# Altium schematic sheet I2C_INTERFACE.SchDoc
size A4; SheetNumber: 12; SheetTotal: 20
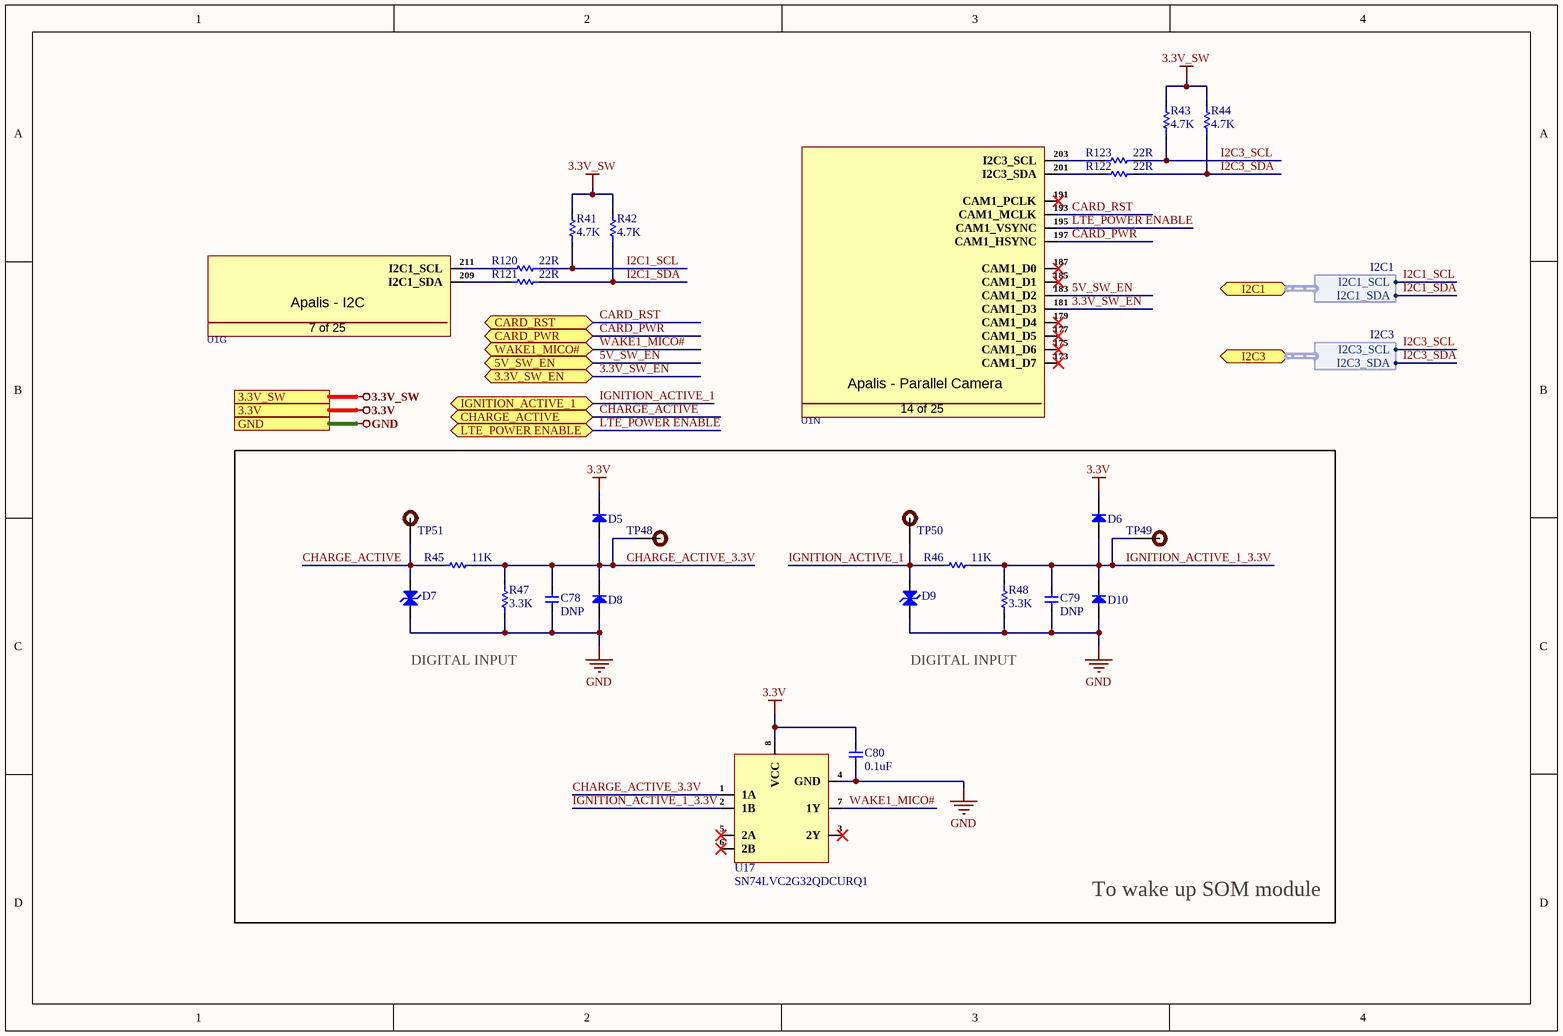
[diagram p0: I2C_INTERFACE.SchDoc]

## Parts
C78  DNP  [Cap-0603]
C79  DNP  [Cap-0603]
C80  0.1uF  [Cap-0402]
D5  BAS316,115  [SOD-323]  (value not drawn)
D6  BAS316,115  [SOD-323]  (value not drawn)
D7  SMAJ14CA-E3/61  [SMA]  (value not drawn)
D8  BAS316,115  [SOD-323]  (value not drawn)
D9  SMAJ14CA-E3/61  [SMA]  (value not drawn)
D10  BAS316,115  [SOD-323]  (value not drawn)
R41  4.7K  [Res-0603]
R42  4.7K  [Res-0603]
R43  4.7K  [Res-0603]
R44  4.7K  [Res-0603]
R45  11K  [Res-0603]
R46  11K  [Res-0603]
R47  3.3K  [Res-0603]
R48  3.3K  [Res-0603]
R120  22R  [Res-0402]
R121  22R  [Res-0402]
R122  22R  [Res-0402]
R123  22R  [Res-0402]
TP48  DNP  [Test-point]  (value not drawn)
TP49  DNP  [Test-point]  (value not drawn)
TP50  DNP  [Test-point]  (value not drawn)
TP51  DNP  [Test-point]  (value not drawn)
U1  MM70-314B1-2-R300  [MM70-314B1-2-R300]  (value not drawn)  (parts G,N of 25)
U17  SN74LVC2G32QDCURQ1  [8-VSSOP]

## Blocks framed on the sheet
To wake up SOM module: C78-C80 D5-D10 R45-R48 TP48-TP51 U17

## Ports
3.3V (see Top_Sheet[3C], 03-CAN2_SPI_CAN_CONTROLLER[1D], APALIS_POWER_SUPPLY[1D], CAN2_SPI_CAN_CONTROLLER[1D], DC_DC_CONVERTER[1D], GPIO_NC_INTERFACE[4B], LTE_MODULE[1D], Reset_and_SDIO[1D]), 3.3V_SW (see Top_Sheet[3C], DIGITAL_I-O_O-P[1D], ETHERNET_INTERFACE[1D], FUTURE_USE_CONNECTOR[1D], HDMI_INTERFACE[1D], MICRO_SD_CARD_INTERFACE[1D], UART_INTERFACE[1D]), 3.3V_SW_EN (bidir, see Top_Sheet[3D], CONNECTORS[2D]), 5V_SW_EN (bidir, see Top_Sheet[3D], CONNECTORS[2D]), CARD_PWR (bidir, see Top_Sheet[2C], LTE_MODULE[3D]), CARD_RST (bidir, see Top_Sheet[2D], LTE_MODULE[3D]), CHARGE_ACTIVE (bidir, see Top_Sheet[3D], CONNECTORS[4D]), GND (see Top_Sheet[2C], 03-CAN2_SPI_CAN_CONTROLLER[1D], APALIS_POWER_SUPPLY[1D], CAN2_SPI_CAN_CONTROLLER[1D], CODEC_INTERFACE[1D], CONNECTORS[1D], DC_DC_CONVERTER[1D], DIGITAL_I-O_O-P[1D], ETHERNET_INTERFACE[1D], FUTURE_USE_CONNECTOR[1D], GPIO_NC_INTERFACE[4B], HDMI_INTERFACE[1D], INPUT_SUPPLY_PROTECTION[1D], LTE_MODULE[1D], MECHANICAL_FOR_PCB[1D], MICRO_SD_CARD_INTERFACE[1D], Reset_and_SDIO[1D], UART_INTERFACE[1D], USB3.0_INTERFACE[1D]), I2C1 (bidir, harness I2C1, see Top_Sheet[3D], CONNECTORS[2C], FUTURE_USE_CONNECTOR[2D]), I2C3 (bidir, harness I2C3, see Top_Sheet[3C], CODEC_INTERFACE[3D], CONNECTORS[2C]), IGNITION_ACTIVE_1 (bidir, see Top_Sheet[3D], CONNECTORS[4D]), LTE_POWER ENABLE (bidir, see Top_Sheet[2D], LTE_MODULE[3D]), WAKE1_MICO# (bidir, see Top_Sheet[2C], FUTURE_USE_CONNECTOR[4C], Reset_and_SDIO[3D])

## Harnesses
I2C3: I2C3_SCL, I2C3_SDA
I2C1: I2C1_SCL, I2C1_SDA

## Nets
3.3V: C80.2 D5.1(K) D6.1(K) U17.8(VCC) ; port 3.3V
3.3V_SW: R41.2 R42.2 R43.2 R44.2 ; port 3.3V_SW
GND: C78.1 C79.1 C80.1 D7.1(A) D8.2(A) D9.1(A) D10.2(A) R47.1 R48.1 U17.4(GND) ; port GND
3.3V_SW_EN: U1.181(CAM1_D3) ; port 3.3V_SW_EN
5V_SW_EN: U1.183(CAM1_D2) ; port 5V_SW_EN
CARD_PWR: U1.197(CAM1_HSYNC) ; port CARD_PWR
CARD_RST: U1.193(CAM1_MCLK) ; port CARD_RST
CHARGE_ACTIVE: D7.2(A) R45.1 TP51.1 ; port CHARGE_ACTIVE
CHARGE_ACTIVE_3.3V: C78.2 D5.2(A) D8.1(K) R45.2 R47.2 TP48.1 U17.1(1A)
I2C1_SCL: R41.1 R120.2 ; port I2C1.I2C1_SCL
I2C1_SDA: R42.1 R121.2 ; port I2C1.I2C1_SDA
I2C3_SCL: R43.1 R123.2 ; port I2C3.I2C3_SCL
I2C3_SDA: R44.1 R122.2 ; port I2C3.I2C3_SDA
IGNITION_ACTIVE_1: D9.2(A) R46.1 TP50.1 ; port IGNITION_ACTIVE_1
IGNITION_ACTIVE_1_3.3V: C79.2 D6.2(A) D10.1(K) R46.2 R48.2 TP49.1 U17.2(1B)
LTE_POWER ENABLE: U1.195(CAM1_VSYNC) ; port LTE_POWER ENABLE
WAKE1_MICO#: U17.7(1Y) ; port WAKE1_MICO#
NetR120_1: R120.1 U1.211(I2C1_SCL)
NetR121_1: R121.1 U1.209(I2C1_SDA)
NetR122_1: R122.1 U1.201(I2C3_SDA)
NetR123_1: R123.1 U1.203(I2C3_SCL)

Not connected (* = marked no-connect by the designer): U1 173(CAM1_D7)* 175(CAM1_D6)* 177(CAM1_D5)* 179(CAM1_D4)* 185(CAM1_D1)* 187(CAM1_D0)* 191(CAM1_PCLK)*; U17 3(2Y)* 5(2A)* 6(2B)*

## Notes on the sheet
- DIGITAL INPUT
- (in symbol MM70-314B1-2-R300, part G) Apalis - I2C; 7 of 25
- (in symbol MM70-314B1-2-R300, part N) Apalis - Parallel Camera; 14 of 25

## Library data of the parts
C78 C79 = C1608NP01H101J080AA: CAP CER 100PF 50V NP0 0603; Manufacturer: TDK; Item Type: Capacitor; Supplier: Arrow Electronics; Supplier Part Number: C1608NP01H101J080AA; Manufacturer Part Number: C1608NP01H101J080AA; RoHS: Yes; Category: Ceramic Capacitors; Stock: 1236; Pricing: 1=0.1172, 10=0.0734, 25=0.0727, 50=0.0628, 100=0.0474, 250=0.0469, 500=0.0388, 1000=0.0313 (USD); ComponentLink1URL: http://www.mouser.com/ds/2/400/tdk_mlcc_commercial_general_en-542463.pdf?src-supplier=Mouser; ComponentLink1Description: http://www.mouser.com/ds/2/400/tdk_mlcc_commercial_general_en-542463.pdf?src-supplier=Mouser; ComponentLink2URL: https://datasheet.octopart.com/C1608NP01H101J080AA-TDK-datasheet-43914282.pdf?src-supplier=Future+Electronics; ComponentLink2Description: https://datasheet.octopart.com/C1608NP01H101J080AA-TDK-datasheet-43914282.pdf?src-supplier=Future+Electronics; ComponentLink3URL: https://product.tdk.com/info/en/catalog/datasheets/mlcc_commercial_hightemp_en.pdf?ref_disty=digikey&src-supplier=Digi-Key; ComponentLink3Description: https://product.tdk.com/info/en/catalog/datasheets/mlcc_commercial_hightemp_en.pdf?ref_disty=digikey&src-supplier=Digi-Key; ComponentLink4URL: https://product.tdk.com/info/en/documents/chara_sheet/C1608NP01H101J080AA.pdf?src-supplier=Digi-Key; ComponentLink4Description: https://product.tdk.com/info/en/documents/chara_sheet/C1608NP01H101J080AA.pdf?src-supplier=Digi-Key; ComponentLink5URL: http://product.tdk.com/en/catalog/datasheets/mlcc_commercial_hightemp_en.pdf?src-supplier=Avnet; ComponentLink5Description: http://product.tdk.com/en/catalog/datasheets/mlcc_commercial_hightemp_en.pdf?src-supplier=Avnet
C80 = C0402C104K4REC7867: Cap Cer 0402 0.1UF 16V X7R 10%; Manufacturer: KEMET; Item Type: Capacitor; Supplier: Digi-Key; Supplier Part Number: 399-C0402C104K4REC7867CT-ND; Manufacturer Part Number: C0402C104K4REC7867; RoHS: No; Category: Ceramic Capacitors; Stock: 10918; Pricing: 1=0.1, 10=0.072, 50=0.0408, 100=0.0338, 500=0.02372, 1000=0.01963, 2500=0.01827, 5000=0.01672 (USD)
D5 D6 D8 D10 = BAS316,115: Rectifier Diode Switching 100V 0.25A 4ns Automotive 2-Pin SOD-323 T/R; Manufacturer: Nexperia; Forward Current: 250mA; Max Forward Surge Current (Ifsm): 500mA; Value: 1.5pF; Max Reverse Current: 500nA; Supplier: Rs; Supplier Part Number: 1821844P; Manufacturer Part Number: BAS316,115; RoHS: Yes; Category: Rectifier Diodes; Stock: 258600; Pricing: 600=0.062, 1200=0.039, 1800=0.037, 2400=0.035 (GBP); Pins: 2NUMBER; Max Operating Temperature: 150°C; Max Repetitive Reverse Voltage (Vrrm): 100V; Packaging: 10Packaging; Reverse Voltage: 100V; Height: 1.1mm; RoHS Compliant: Yes; ComponentLink1URL: http://www.farnell.com/datasheets/1856332.pdf?src-supplier=Farnell; ComponentLink1Description: http://www.farnell.com/datasheets/1856332.pdf?src-supplier=Farnell; ComponentLink2URL: https://assets.nexperia.com/documents/data-sheet/BAS16_SER.pdf?src-supplier=Digi-Key; ComponentLink2Description: https://assets.nexperia.com/documents/data-sheet/BAS16_SER.pdf?src-supplier=Digi-Key; ComponentLink3URL: https://datasheet.octopart.com/BAS316%2C115-Nexperia-datasheet-77871323.pdf?src-supplier=Future+Electronics; ComponentLink3Description: https://datasheet.octopart.com/BAS316%2C115-Nexperia-datasheet-77871323.pdf?src-supplier=Future+Electronics; ComponentLink4URL: https://datasheet.octopart.com/BAS316%2C115-Nexperia-datasheet-32749520.pdf?src-supplier=Element14; ComponentLink4Description: https://datasheet.octopart.com/BAS316%2C115-Nexperia-datasheet-32749520.pdf?src-supplier=Element14; ComponentLink5URL: http://www.farnell.com/datasheets/1856332.pdf?src-supplier=Newark; ComponentLink5Description: http://www.farnell.com/datasheets/1856332.pdf?src-supplier=Newark; ComponentLink6URL: https://datasheet.octopart.com/BAS316%2C115-NXP-datasheet-5319124.pdf?src-supplier=TME; ComponentLink6Description: https://datasheet.octopart.com/BAS316%2C115-NXP-datasheet-5319124.pdf?src-supplier=TME
D7 D9 = SMAJ14CA-E3/61: TVS DIODE 14VWM 23.2VC DO214AC; Manufacturer: Vishay Semiconductors; Supplier: Mouser; Supplier Part Number: 625-SMAJ14CA-E3; Manufacturer Part Number: SMAJ14CA-E3/61; RoHS: Yes; Category: TVS Diodes; Stock: 15510; Pricing: 1=0.48, 10=0.36, 50=0.36, 100=0.221, 1000=0.127, 10000=0.099 (USD); ComponentLink1URL: https://datasheet.ciiva.com/4515/smaj50a-241759-4515304.pdf?src-supplier=Mouser; ComponentLink1Description: https://datasheet.ciiva.com/4515/smaj50a-241759-4515304.pdf?src-supplier=Mouser; ComponentLink2URL: https://datasheet.ciiva.com/16382/smaj50a-16382075.pdf?src-supplier=Future+Electronics; ComponentLink2Description: https://datasheet.ciiva.com/16382/smaj50a-16382075.pdf?src-supplier=Future+Electronics
R41-R44 = ERA-3AEB472V: RES SMD 4.7K OHM 0.1% 1/10W 0603; Manufacturer: Panasonic; Supplier: Rs; Supplier Part Number: 566888P; Manufacturer Part Number: ERA-3AEB472V; RoHS: Yes; Category: Chip SMD Resistors; Stock: 5210; Pricing: 50=0.242, 100=0.198, 250=0.156, 500=0.114 (GBP); ComponentLink1URL: https://datasheet.ciiva.com/11808/0900766b80fe20f7-11808039.pdf?src-supplier=Rs; ComponentLink1Description: https://datasheet.ciiva.com/11808/0900766b80fe20f7-11808039.pdf?src-supplier=Rs; ComponentLink2URL: https://datasheet.ciiva.com/29183/451124-da-01-en-widerstand-0603-era-29183789.pdf?src-supplier=Conrad; ComponentLink2Description: https://datasheet.ciiva.com/29183/451124-da-01-en-widerstand-0603-era-29183789.pdf?src-supplier=Conrad; ComponentLink3URL: https://datasheet.ciiva.com/22743/485442-22743061.pdf?src-supplier=Element14; ComponentLink3Description: https://datasheet.ciiva.com/22743/485442-22743061.pdf?src-supplier=Element14; ComponentLink4URL: https://datasheet.ciiva.com/46422/485442-46422693.pdf?src-supplier=Element14; ComponentLink4Description: https://datasheet.ciiva.com/46422/485442-46422693.pdf?src-supplier=Element14; ComponentLink5URL: https://datasheet.ciiva.com/30078/54aoa0000ce26-30078815.pdf?src-supplier=Onlinecomponents.com; ComponentLink5Description: https://datasheet.ciiva.com/30078/54aoa0000ce26-30078815.pdf?src-supplier=Onlinecomponents.com; ComponentLink6URL: https://datasheet.ciiva.com/16772/70068849-16772572.pdf?src-supplier=Allied+Electronics; ComponentLink6Description: https://datasheet.ciiva.com/16772/70068849-16772572.pdf?src-supplier=Allied+Electronics; ComponentLink7URL: https://datasheet.ciiva.com/48425/era-eng-tds-48425470.pdf?src-supplier=Distrelec; ComponentLink7Description: https://datasheet.ciiva.com/48425/era-eng-tds-48425470.pdf?src-supplier=Distrelec; ComponentLink8URL: https://datasheet.ciiva.com/22781/485442-22781497.pdf?src-supplier=Farnell; ComponentLink8Description: https://datasheet.ciiva.com/22781/485442-22781497.pdf?src-supplier=Farnell; ComponentLink9URL: https://datasheet.ciiva.com/43455/485442-43455227.pdf?src-supplier=Farnell; ComponentLink9Description: https://datasheet.ciiva.com/43455/485442-43455227.pdf?src-supplier=Farnell; ComponentLink10URL: https://datasheet.ciiva.com/9117/aoa0000ce26-9117707.pdf?src-supplier=Avnet; ComponentLink10Description: https://datasheet.ciiva.com/9117/aoa0000ce26-9117707.pdf?src-supplier=Avnet; ComponentLink11URL: https://datasheet.ciiva.com/9116/aoa0000ce26-9116681.pdf?src-supplier=Avnet; ComponentLink11Description: https://datasheet.ciiva.com/9116/aoa0000ce26-9116681.pdf?src-supplier=Avnet
R45 R46 = RT0603DRD0711KL: RES SMD 11K OHM 0.5% 1/10W 0603; Manufacturer: Yageo; Supplier: Future Electronics; Supplier Part Number: 3061514; Manufacturer Part Number: RT0603DRD0711KL; RoHS: Yes; Category: Chip SMD Resistors; Stock: 70000; Pricing: 5000=0.0133, 15000=0.0128, 25000=0.0126, 100000=0.012, 150000=0.0117 (USD); ComponentLink1URL: https://datasheet.ciiva.com/8891/pyu-rt-1-to-0-05-rohs-l-4-8891301.pdf?src-supplier=Avnet; ComponentLink1Description: https://datasheet.ciiva.com/8891/pyu-rt-1-to-0-05-rohs-l-4-8891301.pdf?src-supplier=Avnet
R47 R48 = ERJ-U3RD3301V: RES 3.3K OHM 0.5% 1/10W 0603 SMD; Manufacturer: Panasonic; Supplier: Mouser; Supplier Part Number: 667-ERJ-U3RD3301V; Manufacturer Part Number: ERJ-U3RD3301V; RoHS: No; Category: Chip SMD Resistors; Stock: 19153; Pricing: 1=0.19, 10=0.105, 50=0.105, 100=0.047, 1000=0.029, 10000=0.023 (USD)
R120-R123 = CRGCQ0402J22R: RES 22 OHM 5% 1/16W 0402; Manufacturer: TE Connectivity; Supplier: Avnet; Supplier Part Number: 73AC8982; Manufacturer Part Number: CRGCQ0402J22R; RoHS: Yes; Category: Chip SMD Resistors; Stock: 20000; Pricing: 1=0.036, 25=0.01, 100=0.008, 250=0.006, 500=0.005 (USD); ComponentLink1URL: https://www.te.com/commerce/DocumentDelivery/DDEController?Action=srchrtrv&amp;DocNm=1773204-3&amp;DocType=DS&amp;DocLang=English&src-supplier=Digi-Key; ComponentLink1Description: https://www.te.com/commerce/DocumentDelivery/DDEController?Action=srchrtrv&amp;DocNm=1773204-3&amp;DocType=DS&amp;DocLang=English&src-supplier=Digi-Key; ComponentLink2URL: https://4donline.ihs.com/images/VipMasterIC/IC/TYEL/TYEL-S-A0004929575/TYEL-S-A0004929575-1.pdf?hkey=52A5661711E402568146F3353EA87419&src-supplier=Newark; ComponentLink2Description: https://4donline.ihs.com/images/VipMasterIC/IC/TYEL/TYEL-S-A0004929575/TYEL-S-A0004929575-1.pdf?hkey=52A5661711E402568146F3353EA87419&src-supplier=Newark; ComponentLink3URL: https://4donline.ihs.com/images/VipMasterIC/IC/TYEL/TYEL-S-A0004929575/TYEL-S-A0004929575-1.pdf?hkey=52A5661711E402568146F3353EA87419&src-supplier=Element14; ComponentLink3Description: https://4donline.ihs.com/images/VipMasterIC/IC/TYEL/TYEL-S-A0004929575/TYEL-S-A0004929575-1.pdf?hkey=52A5661711E402568146F3353EA87419&src-supplier=Element14; ComponentLink4URL: https://datasheet.octopart.com/CRGCQ0402J22R-TE-Connectivity-datasheet-114679081.pdf?src-supplier=Master+Electronics; ComponentLink4Description: https://datasheet.octopart.com/CRGCQ0402J22R-TE-Connectivity-datasheet-114679081.pdf?src-supplier=Master+Electronics
TP48-TP51 = TEST POINT: Test Point ON; Item Type: TEST POINT
U1 = MM70-314B1-2-R300: CONN MXM 3.0 FMALE 314POS 0.020; Manufacturer: JAE Electronics; Supplier: Digi-Key; Supplier Part Number: 670-MM70-314B1-2-R300CT-ND; Manufacturer Part Number: MM70-314B1-2-R300; RoHS: No; Category: Card Edge Connectors; Stock: 4979; Pricing: 1=9.21, 10=8.287, 25=7.8064, 50=7.6064, 100=7.4062 (USD)
U17 = SN74LVC2G32QDCURQ1: IC GATE OR 2CH 2-INP 8VSSOP; Manufacturer: Texas Instruments; Supplier: Mouser; Supplier Part Number: 595-74LVC2G32QDCURQ1; Manufacturer Part Number: SN74LVC2G32QDCURQ1; RoHS: Yes; Category: Logic Gates; Stock: 7957; Pricing: 1=0.8, 10=0.665, 50=0.665, 100=0.505, 1000=0.343, 10000=0.275 (USD); ComponentLink1URL: https://datasheet.ciiva.com/12072/sn74lvc2g32-q1-213877-12072967.pdf?src-supplier=Mouser; ComponentLink1Description: https://datasheet.ciiva.com/12072/sn74lvc2g32-q1-213877-12072967.pdf?src-supplier=Mouser; ComponentLink2URL: https://datasheet.ciiva.com/6619/sn74lvc2g32-q1-6619488.pdf?src-supplier=Digi-Key; ComponentLink2Description: https://datasheet.ciiva.com/6619/sn74lvc2g32-q1-6619488.pdf?src-supplier=Digi-Key; ComponentLink3URL: https://datasheet.ciiva.com/14311/sn74lvc2g32-q1-14311324.pdf?src-supplier=Avnet; ComponentLink3Description: https://datasheet.ciiva.com/14311/sn74lvc2g32-q1-14311324.pdf?src-supplier=Avnet; ComponentLink4URL: https://datasheet.ciiva.com/6619/sn74lvc2g32-q1-6619483.pdf?src-supplier=Digi-Key; ComponentLink4Description: https://datasheet.ciiva.com/6619/sn74lvc2g32-q1-6619483.pdf?src-supplier=Digi-Key; ComponentLink5URL: https://datasheet.ciiva.com/6619/sn74lvc2g32-q1-6619485.pdf?src-supplier=Digi-Key; ComponentLink5Description: https://datasheet.ciiva.com/6619/sn74lvc2g32-q1-6619485.pdf?src-supplier=Digi-Key